# Altium schematic sheet Supply_Section.SchDoc
size A
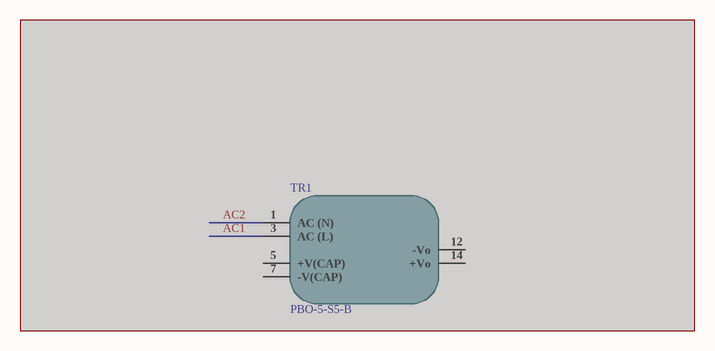
[diagram p0: Supply_Section.SchDoc]

## Parts
TR1  PBO-5-S5-B  [PBO-5-S5-B]  (masked out: inside a compile mask, not in the netlist)

## Library data of the parts
TR1 = PBO-5-S5-B: AC/DC CONVERTER 5VDC 5W; Manufacturer: CUI; Number of Outputs: 1; Voltage - Output 1: 5V; Max Output Current: 1A; Efficiency: 74%; Approvals: CE,cURus; ComponentLink1URL: https://www.cui.com/product/resource/digikeypdf/pbo-5.pdf?src-supplier=Digi-Key; ComponentLink1Description: https://www.cui.com/product/resource/digikeypdf/pbo-5.pdf?src-supplier=Digi-Key; Supplier 1: Digi-Key; Manufacturer Part Number: PBO-5-S5-B; RoHS: No; Category: Board Mount Modules; Stock 1: 238; Pricing 1: 1=11.88000, 5=11.71200, 10=11.54300, 25=10.86400, 50=10.52460, 100=10.18500, 250=9.84552, 500=9.50600 (USD); Mount: Through Hole; Min Operating Temperature: -25°C; Max Operating Temperature: 85°C; Max Power Dissipation: 5W; RoHS Compliant: No; Supplier Part Number 1: 102-4987-ND